# Altium schematic sheet Main.SchDoc
size A4; SheetNumber: 1; SheetTotal: 3
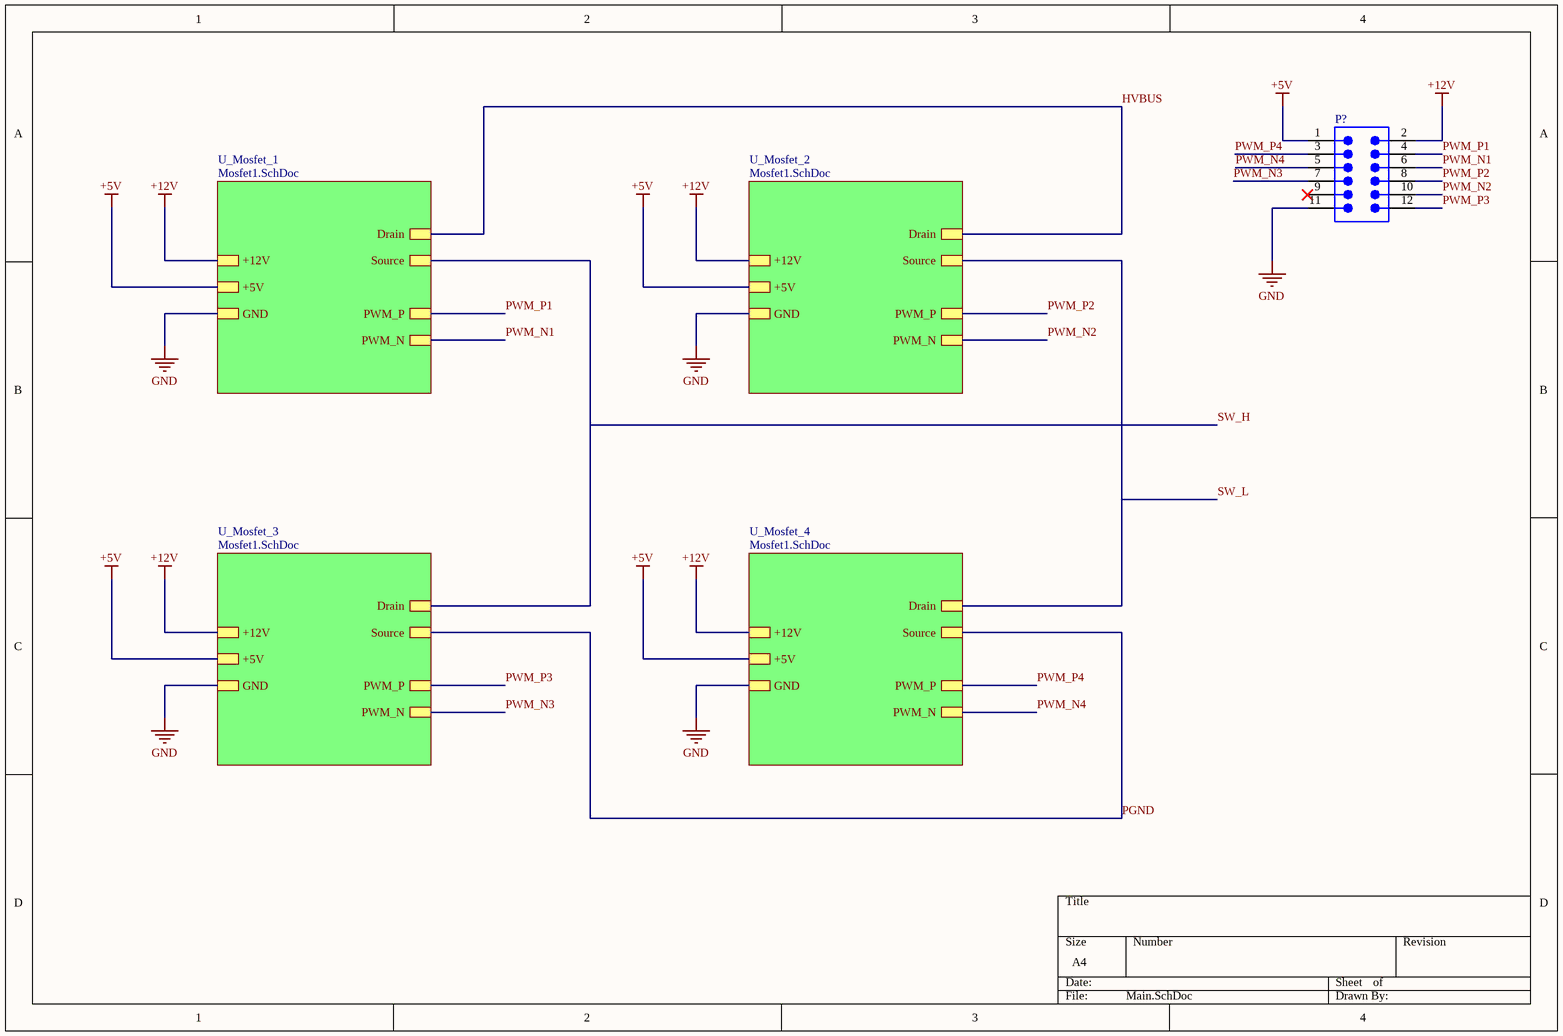
[diagram p0: Main.SchDoc]

## Parts
P?  61301221021  [61301221021]  (value not drawn)

## Sub-sheets
U_Mosfet_1 = Mosfet1.SchDoc: Drain, Source, +12V, +5V, GND, PWM_P, PWM_N
U_Mosfet_2 = Mosfet1.SchDoc: Drain, Source, +12V, +5V, GND, PWM_P, PWM_N
U_Mosfet_3 = Mosfet1.SchDoc: Drain, Source, +12V, +5V, GND, PWM_P, PWM_N
U_Mosfet_4 = Mosfet1.SchDoc: Drain, Source, +12V, +5V, GND, PWM_P, PWM_N

## Nets
+5V: P?.1 ; sheet U_Mosfet_1/+5V, sheet U_Mosfet_2/+5V, sheet U_Mosfet_3/+5V, sheet U_Mosfet_4/+5V
+12V: P?.2 ; sheet U_Mosfet_1/+12V, sheet U_Mosfet_2/+12V, sheet U_Mosfet_3/+12V, sheet U_Mosfet_4/+12V
GND: P?.11 ; sheet U_Mosfet_1/GND, sheet U_Mosfet_2/GND, sheet U_Mosfet_3/GND, sheet U_Mosfet_4/GND
HVBUS: sheet U_Mosfet_1/Drain, sheet U_Mosfet_2/Drain
PGND: sheet U_Mosfet_3/Source, sheet U_Mosfet_4/Source
PWM_N1: P?.6 ; sheet U_Mosfet_1/PWM_N
PWM_N2: P?.10 ; sheet U_Mosfet_2/PWM_N
PWM_N3: P?.7 ; sheet U_Mosfet_3/PWM_N
PWM_N4: P?.5 ; sheet U_Mosfet_4/PWM_N
PWM_P1: P?.4 ; sheet U_Mosfet_1/PWM_P
PWM_P2: P?.8 ; sheet U_Mosfet_2/PWM_P
PWM_P3: P?.12 ; sheet U_Mosfet_3/PWM_P
PWM_P4: P?.3 ; sheet U_Mosfet_4/PWM_P
SW_H: sheet U_Mosfet_1/Source, sheet U_Mosfet_3/Drain
SW_L: sheet U_Mosfet_2/Source, sheet U_Mosfet_4/Drain

Not connected (* = marked no-connect by the designer): P? 9*

## Library data of the parts
P? = 61301221021: WR-PHD Pin Header, THT, Angled, pitch 2.54mm, 2 Row, 12P; Manufacturer: Wurth Elektronik; Contact Resistance: 20mOhm; Rated Current: 3A; Working Voltage: 250V; Withstanding Voltage: 500V; Manufacturer Part Number: 61301221021; Category: Board-to-Board Connectors; Match Code: WR-PHD; ComponentLink1Description: Website Link; ComponentLink1URL: https://www.we-online.com/redexpert/article/61301221021?ad; ComponentLink2Description: Datasheet Link; ComponentLink2URL: https://www.we-online.com/redexpert/spec/61301221021?ad; Mount: Through Hole; Min Operating Temperature: -40°C; Max Operating Temperature: 105°C; Packaging: Bag; Gender: Pin Header; Number of Pins: 12; Number of Rows: 2; Orientation: Angled; Lead Pitch: 2.54mm